# Altium project ENG_BLDC_Motor_Controller.PrjPcb
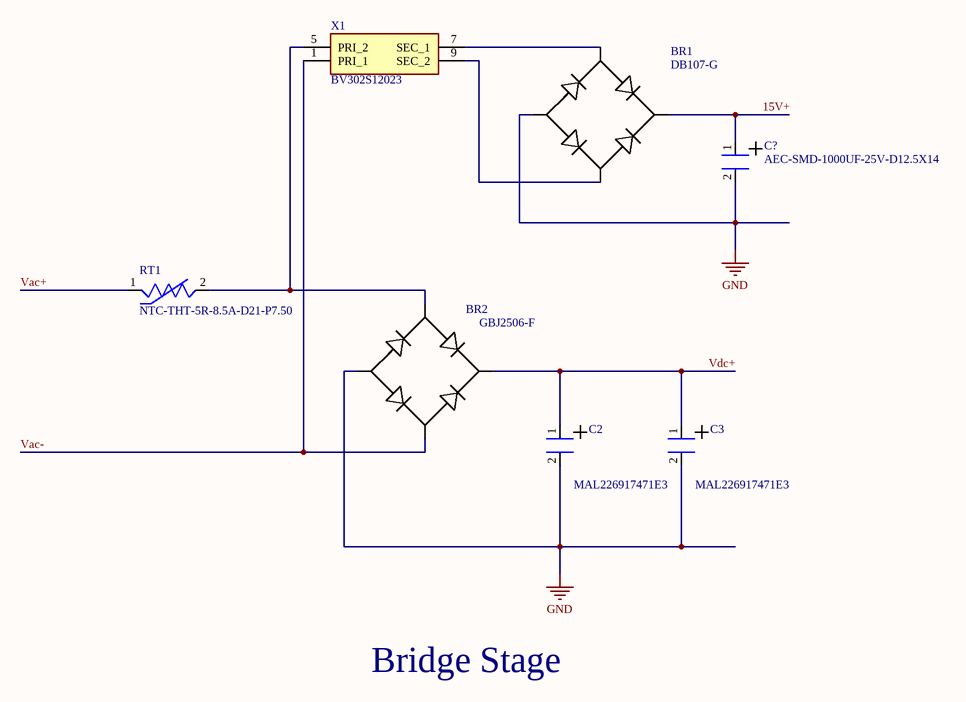
[diagram p0: 01_Bridge_Stage.SchDoc]
3 sheets, 49 parts. Net scope: global (net labels, ports and power ports of the same name join across sheets).
Board file: PCB_Main.PcbDoc
Sheets:
  01_Bridge_Stage.SchDoc
  02_MosfetDrive_Stage.SchDoc
  03_Headers-Mesaurements.SchDoc

## Sheet 01_Bridge_Stage.SchDoc
size A4; SheetNumber: 1; SheetTotal: 3

### Parts
BR1  DB107-G  [895_DB107-G]
BR2  GBJ2506-F  [996_GBJ2506-F]
C2  MAL226917471E3  [099_MAL226917471E3]
C3  MAL226917471E3  [099_MAL226917471E3]
C?  AEC-SMD-1000UF-25V-D12.5X14  [096_AEC-SMD-1000UF-25V-D12.5X14]
RT1  NTC-THT-5R-8.5A-D21-P7.50  [308_NTC-THT-5R-8.5A-D21-P7.50]
X1  BV302S12023  [899_BV302S12023]

### Nets
GND: BR1.2 BR2.4 C2.2 C3.2 C?.2
15V+: BR1.1 C?.1
Vac+: RT1.1
Vac-: BR2.3 X1.1(PRI_1)
Vdc+: BR2.1 C2.1 C3.1
NetBR1_3: BR1.3 X1.7(SEC_1)
NetBR1_4: BR1.4 X1.9(SEC_2)
NetBR2_2: BR2.2 RT1.2 X1.5(PRI_2)

### Notes on the sheet
- Bridge Stage

### Library data of the parts
BR1 = DB107-G: Single-phase bridge rectifier, 1 A, 1000 V, 4-pin through-hole DB package. Rectifies the auxiliary transformer output.; Manufacturer_Name: MCC; Manufacturer_Part_Number: DB107-BP; Copyright: Copyright (C) 2026 Ultra Librarian. All rights reserved.
BR2 = GBJ2506-F: Bridge Rectifier; Manufacturer_Name: Diodes Incorporated; Datasheet Link: https://www.google.co.uk/search?q=diodes+GBJ2506-F&rlz=1C1CHBF_en-GBGB756GB756&oq=diodes+GBJ2506-F&aqs=chrome..69i57j69i64.1269j0j4&sourceid=chrome&ie=UTF-8; Manufacturer_Part_Number: GBJ2506-F; Mouser Part Number: 621-GBJ2506-F; Mouser Price/Stock: https://www.mouser.co.uk/ProductDetail/Diodes-Incorporated/GBJ2506-F?qs=mQbszxtPdlOUVtYxZe82iQ%3D%3D; Arrow Part Number: GBJ2506-F; Arrow Price/Stock: https://www.arrow.com/en/products/gbj2506-f/diodes-incorporated.html?utm_currency=USD&region=europe
C2 C3 = MAL226917471E3: 470 µF, 450 V polarized aluminum electrolytic capacitor, snap-in THT, Ø35 mm body, 10 mm lead spacing, 105 °C rated.
C? = AEC-SMD-1000UF-25V-D12.5X14: Polarized SMD aluminum electrolytic capacitor, 1000 µF, 25 V, Ø12.5 × 14 mm. Filters the auxiliary DC supply.
RT1 = NTC-THT-5R-8.5A-D21-P7.50: Through-hole NTC inrush current limiter, 5 Ω at 25 °C, 8.5 A, Ø21 mm disc, 7.50 mm lead pitch. Limits the DC-link capacitor charging current at power-up.; MF: EPCOS; MP: B57211P0509M301; Package: None; Price: None; Check_prices: https://www.snapeda.com/parts/B57211P0509M301/EPCOS/view-part/?ref=eda; Value: *; SnapEDA_Link: https://www.snapeda.com/parts/B57211P0509M301/EPCOS/view-part/?ref=snap; Availability: In Stock; Purchase-URL: https://pricing.snapeda.com/search?q=B57211P0509M301&ref=eda
X1 = BV302S12023: 2.3VA Encapsulated Transformer 50/60Hz; Manufacturer_Name: Zettler Group; Geometry.Height: 29.8mm; Manufacturer_Part_Number: BV302S12023; Mouser Part Number: *; Mouser Price/Stock: *; Arrow Part Number: *; Arrow Price/Stock: *; Datasheet Link: https://www.zettlermagnetics.com/pdfs/EI30_23.pdf

## Sheet 02_MosfetDrive_Stage.SchDoc
size A4; SheetNumber: 2; SheetTotal: 3
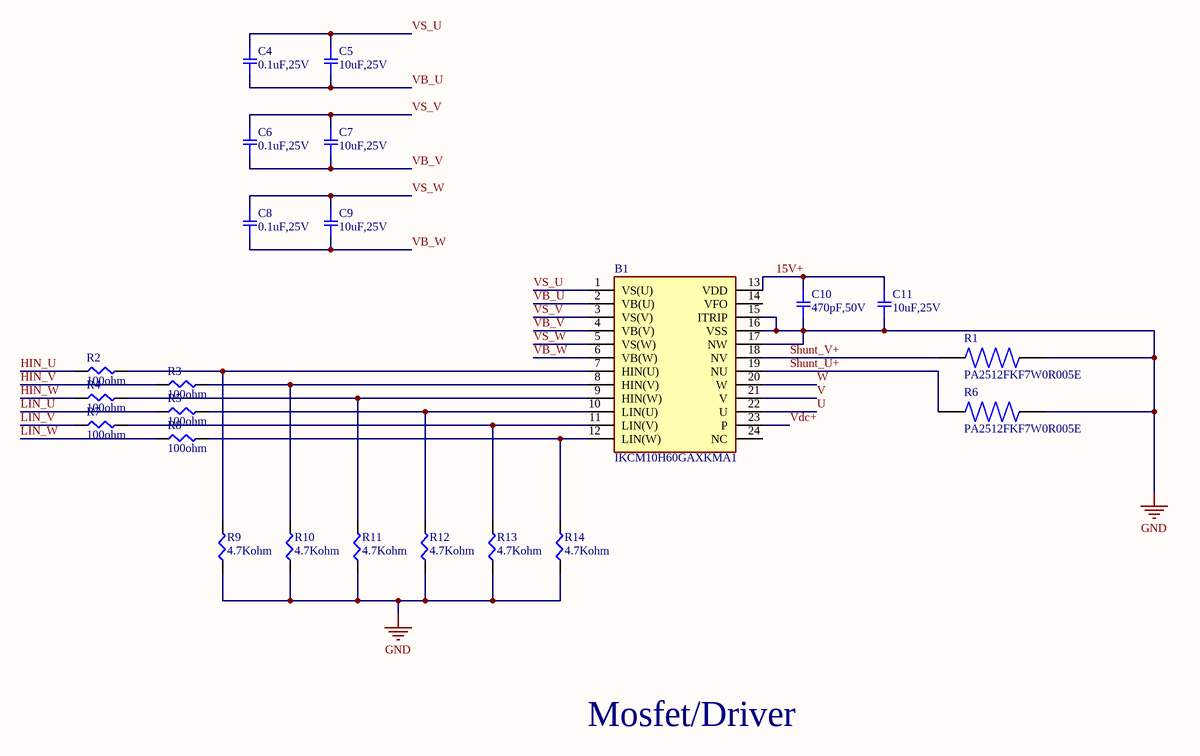
[diagram p1: 02_MosfetDrive_Stage.SchDoc]

### Parts
B1  IKCM10H60GAXKMA1  [997_IKCM10H60GAXKMA1]
C4  0.1uF,25V  [001_SMD-1206]
C5  10uF,25V  [001_SMD-1206]
C6  0.1uF,25V  [001_SMD-1206]
C7  10uF,25V  [001_SMD-1206]
C8  0.1uF,25V  [001_SMD-1206]
C9  10uF,25V  [001_SMD-1206]
C10  470pF,50V  [001_SMD-1206]
C11  10uF,25V  [001_SMD-1206]
R1  PA2512FKF7W0R005E  [097_PA2512FKF7W0R005E]
R2  100ohm  [001_SMD-1206]
R3  100ohm  [001_SMD-1206]
R4  100ohm  [001_SMD-1206]
R5  100ohm  [001_SMD-1206]
R6  PA2512FKF7W0R005E  [097_PA2512FKF7W0R005E]
R7  100ohm  [001_SMD-1206]
R8  100ohm  [001_SMD-1206]
R9  4.7Kohm  [001_SMD-1206]
R10  4.7Kohm  [001_SMD-1206]
R11  4.7Kohm  [001_SMD-1206]
R12  4.7Kohm  [001_SMD-1206]
R13  4.7Kohm  [001_SMD-1206]
R14  4.7Kohm  [001_SMD-1206]

### Nets
GND: B1.15(ITRIP) B1.16(VSS) B1.17(NW) C10.2 C11.2 R1.2 R6.2 R9.1 R10.1 R11.1 R12.1 R13.1 R14.1
15V+: B1.13(VDD) C10.1 C11.1
HIN_U: R2.1
HIN_V: R3.1
HIN_W: R4.1
LIN_U: R5.1
LIN_V: R7.1
LIN_W: R8.1
Shunt_U+: B1.19(NU) R6.1
Shunt_V+: B1.18(NV) R1.1
U: B1.22(U)
V: B1.21(V)
VB_U: B1.2(VB(U)) C4.2 C5.2
VB_V: B1.4(VB(V)) C6.2 C7.2
VB_W: B1.6(VB(W)) C8.2 C9.2
Vdc+: B1.23(P)
VS_U: B1.1(VS(U)) C4.1 C5.1
VS_V: B1.3(VS(V)) C6.1 C7.1
VS_W: B1.5(VS(W)) C8.1 C9.1
W: B1.20(W)
NetB1_7: B1.7(HIN(U)) R2.2 R9.2
NetB1_8: B1.8(HIN(V)) R3.2 R10.2
NetB1_9: B1.9(HIN(W)) R4.2 R11.2
NetB1_10: B1.10(LIN(U)) R5.2 R12.2
NetB1_11: B1.11(LIN(V)) R7.2 R13.2
NetB1_12: B1.12(LIN(W)) R8.2 R14.2

Not connected (* = marked no-connect by the designer): B1 14(VFO) 24(NC)

### Notes on the sheet
- Mosfet/Driver

### Library data of the parts
B1 = IKCM10H60GAXKMA1: Intelligent Power Module 3-Ph 600V 10A; Manufacturer_Name: Infineon; Geometry.Height: 5.6mm; Manufacturer_Part_Number: IKCM10H60GAXKMA1; Mouser Part Number: 726-IKCM10H60GAXKMA1; Mouser Price/Stock: https://www.mouser.co.uk/ProductDetail/Infineon-Technologies/IKCM10H60GAXKMA1?qs=hdSwu7a6m9Y5VjDgSjSs%2Fw%3D%3D; Arrow Part Number: IKCM10H60GAXKMA1; Arrow Price/Stock: https://www.arrow.com/en/products/ikcm10h60gaxkma1/infineon-technologies-ag; Datasheet Link: https://www.infineon.com/dgdl/Infineon-IKCM10H60GA-DS-v02_04-EN.pdf?fileId=5546d4624fb7fef2014fcb43a49a78bb
C4-C11 = C_1206_Template: CAP CER 1206; Part Number: GC321AD72E103KX01D; Manufacturer: Murata Electronics North America; Factory Stock: 0; Unit Price (USD): 0.3; Minimum Quantity: 1; Value: 10000pF; Tolerance: ±10%; Voltage: 250V; Temperature Coefficient: X7T; Datasheets: http://search.murata.co.jp/Ceramy/image/img/A01X/G101/ENG/GC321AD72E103KX01-01.pdf; Image: //media.digikey.com/Renders/Murata%20Renders/0805(GC3)200x125.jpg; Digi-Key Part Number: 490-13986-1-ND; Quantity Available: 4000; @ qty: 0; Packaging: Cut Tape (CT); Series: GC3; Part Status: Active; Operating Temperature: -55°C ~ 125°C; Features: -; Ratings: AEC-Q200; Applications: Automotive; Mounting Type: Surface Mount, MLCC; Package / Case: 0805 (2012 Metric); Size / Dimension: 0.079" L x 0.049" W (2.00mm x 1.25mm); Height - Seated (Max): -; Thickness (Max): 0.039" (1.00mm); Lead Spacing: -; Lead Style: -
R1 R6 = PA2512FKF7W0R005E: 5 mΩ, 2 W, ±1% current-sense shunt resistor, 2512 (6332 metric) SMD package, low-resistance metal-element construction.; MF: Bourns; MP: CRF2512-FZ-R005ELF; SnapEDA_Link: https://www.snapeda.com/parts/CRF2512-FZ-R005ELF/Bourns/view-part/?ref=snap; Package: 6432 Bourns; Value: *; Check_prices: https://www.snapeda.com/parts/CRF2512-FZ-R005ELF/Bourns/view-part/?ref=eda
R2-R5 R7-R14 = R_1206_Template: RES SMD 1206; Part Number: ERJ-8BQF1R0V; Manufacturer: Panasonic Electronic Components; Factory Stock: 0; Unit Price (USD): 0.05778; @ qty: 1500; Minimum Quantity: 1; Value: 1; Tolerance: ±1%; Power (Watts): 0.5W, 1/2W; Temperature Coefficient: ±200ppm/°C; Datasheets: https://industrial.panasonic.com/cdbs/www-data/pdf/RDA0000/AOA0000C239.pdf; Image: //media.digikey.com/Renders/Panasonic%20Renders/ERJ-1206%20Pkg.jpg; Digi-Key Part Number: P17600CT-ND; Quantity Available: 2046; Packaging: Cut Tape (CT); Series: ERJ; Part Status: Active; Composition: Thick Film; Features: Automotive AEC-Q200, Current Sense; Operating Temperature: -55°C ~ 125°C; Package / Case: 1206 (3216 Metric); Supplier Device Package: 1206; Size / Dimension: 0.126" L x 0.063" W (3.20mm x 1.60mm); Height - Seated (Max): 0.028" (0.70mm); Number of Terminations: 2; Failure Rate: -

## Sheet 03_Headers-Mesaurements.SchDoc
size A4; SheetNumber: 3; SheetTotal: 3
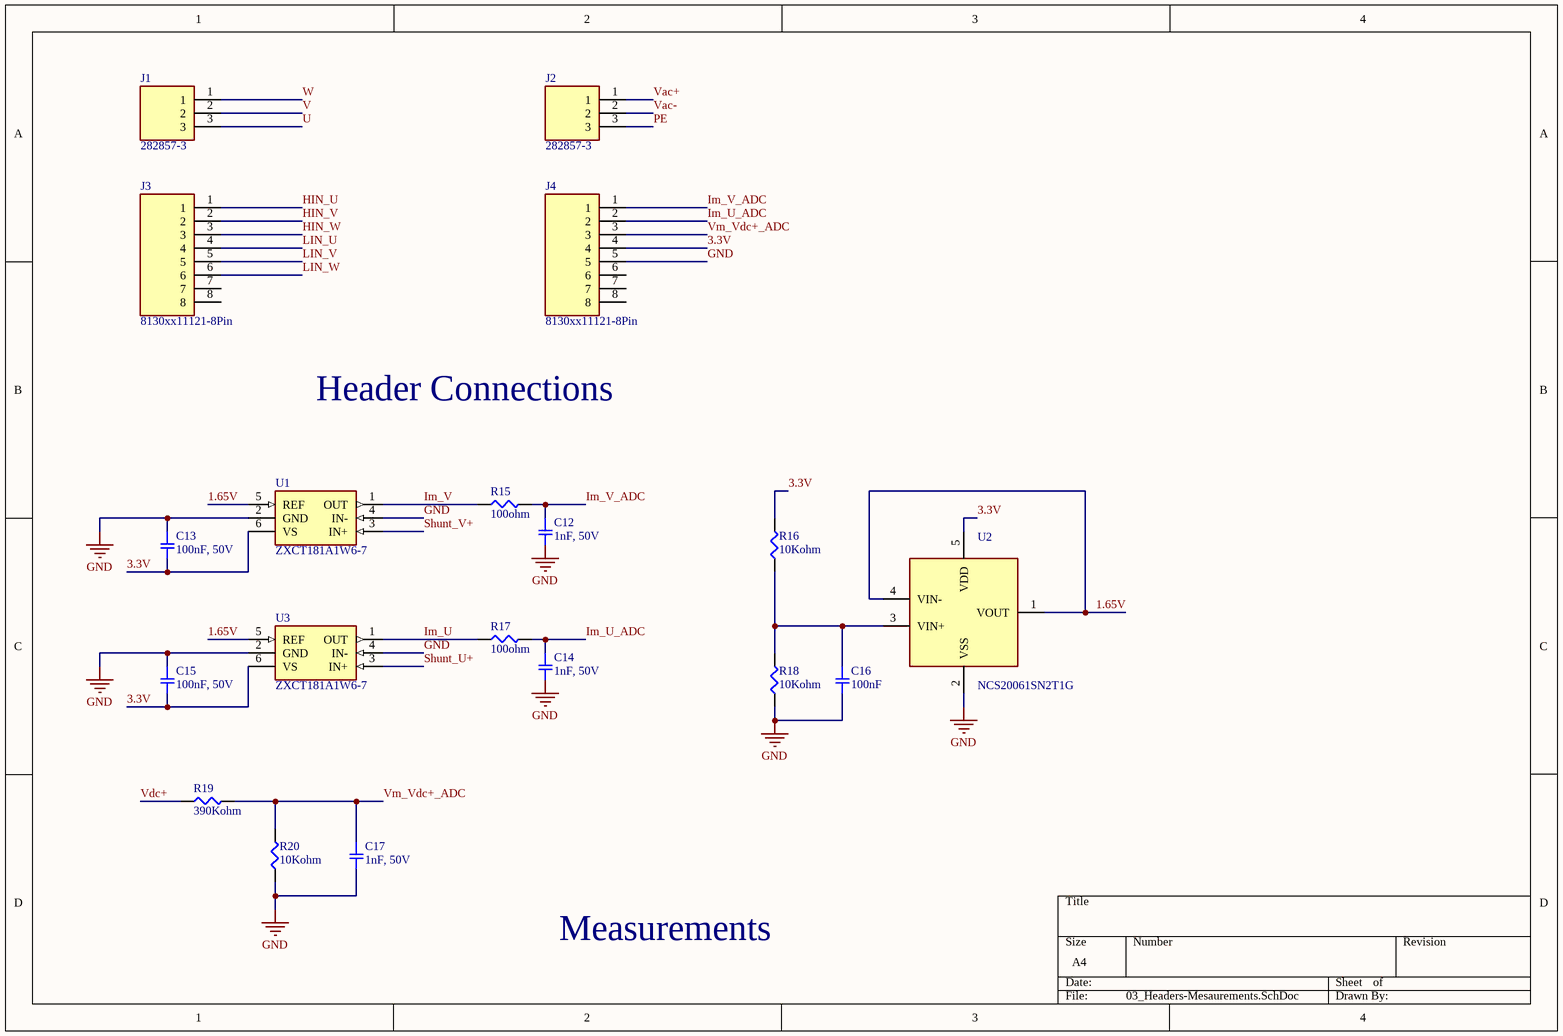
[diagram p2: 03_Headers-Mesaurements.SchDoc]

### Parts
C12  1nF, 50V  [001_SMD-1206]
C13  100nF, 50V  [001_SMD-1206]
C14  1nF, 50V  [001_SMD-1206]
C15  100nF, 50V  [001_SMD-1206]
C16  100nF  [001_SMD-1206]
C17  1nF, 50V  [001_SMD-1206]
J1  282857-3  [201_TE_282857-3]
J2  282857-3  [201_TE_282857-3]
J3  8130xx11121-8Pin  [200_HDRV6W64P0X254_1X6_1524X254X869P]
J4  8130xx11121-8Pin  [200_HDRV6W64P0X254_1X6_1524X254X869P]
R15  100ohm  [001_SMD-1206]
R16  10Kohm  [001_SMD-1206]
R17  100ohm  [001_SMD-1206]
R18  10Kohm  [001_SMD-1206]
R19  390Kohm  [001_SMD-1206]
R20  10Kohm  [001_SMD-1206]
U1  ZXCT181A1W6-7  [896_ZXCT181A1W6-7]
U2  NCS20061SN2T1G  [897_NCS20061SN2T1G]
U3  ZXCT181A1W6-7  [896_ZXCT181A1W6-7]

### Nets
GND: C12.2 C13.1 C14.2 C15.1 C16.2 C17.2 J4.5 R18.1 R20.1 U1.2(GND) U1.4(IN-) U2.2(VSS) U3.2(GND) U3.4(IN-)
1.65V: U1.5(REF) U2.1(VOUT) U2.4(VIN-) U3.5(REF)
3.3V: C13.2 C15.2 J4.4 R16.2 U1.6(VS) U2.5(VDD) U3.6(VS)
HIN_U: J3.1
HIN_V: J3.2
HIN_W: J3.3
Im_U: R17.1 U3.1(OUT)
Im_U_ADC: C14.1 J4.2 R17.2
Im_V: R15.1 U1.1(OUT)
Im_V_ADC: C12.1 J4.1 R15.2
LIN_U: J3.4
LIN_V: J3.5
LIN_W: J3.6
PE: J2.3
Shunt_U+: U3.3(IN+)
Shunt_V+: U1.3(IN+)
U: J1.3
V: J1.2
Vac+: J2.1
Vac-: J2.2
Vdc+: R19.1
Vm_Vdc+_ADC: C17.1 J4.3 R19.2 R20.2
W: J1.1
NetC16_1: C16.1 R16.1 R18.2 U2.3(VIN+)

Not connected (* = marked no-connect by the designer): J3 7 8; J4 6 7 8

### Notes on the sheet
- Header Connections
- Measurements

### Library data of the parts
C12-C17 = C_1206_Template: as C4 on sheet 02_MosfetDrive_Stage; Datasheets: http://search.murata.co.jp/Ceramy/image/img/A01X/G101/ENG/GC321AD72E103KX01-01.pdf; Image: //media.digikey.com/Renders/Murata%20Renders/0805(GC3)200x125.jpg; Digi-Key Part Number: 490-13986-1-ND; Quantity Available: 4000; @ qty: 0; Packaging: Cut Tape (CT); Series: GC3; Part Status: Active; Operating Temperature: -55°C ~ 125°C; Features: -; Ratings: AEC-Q200; Applications: Automotive; Mounting Type: Surface Mount, MLCC; Package / Case: 0805 (2012 Metric); Size / Dimension: 0.079" L x 0.049" W (2.00mm x 1.25mm); Height - Seated (Max): -; Thickness (Max): 0.039" (1.00mm); Lead Spacing: -; Lead Style: -
J1 J2 = 282857-3: 3 Position Wire to Board Terminal Block Horizontal with Board 0.200 (5.08mm) Through Hole; MF: TE Connectivity; SnapEDA_Link: https://www.snapeda.com/parts/282857-3/TE+Connectivity+AMP+Connectors/view-part/?ref=snap; Package: None; Value: *; MP: 282857-3; EU_RoHS_Compliance: Compliant with Exemptions; Check_prices: https://www.snapeda.com/parts/282857-3/TE+Connectivity+AMP+Connectors/view-part/?ref=eda
J3 J4 = 6130xx11121-6Pin: 2.54MM PIN HEADER; Manufacturer_Name: Wurth Elektronik; Geometry.Height: 8.69mm; Manufacturer_Part_Number: 6130xx11121-6Pin; Mouser Part Number: *; Mouser Price/Stock: *; Arrow Part Number: *; Arrow Price/Stock: *; Datasheet Link: https://www.we-online.com/katalog/datasheet/6130xx11121.pdf
R15-R20 = R_1206_Template: as R2 on sheet 02_MosfetDrive_Stage; Datasheets: https://industrial.panasonic.com/cdbs/www-data/pdf/RDA0000/AOA0000C239.pdf; Image: //media.digikey.com/Renders/Panasonic%20Renders/ERJ-1206%20Pkg.jpg; Digi-Key Part Number: P17600CT-ND; Quantity Available: 2046; Packaging: Cut Tape (CT); Series: ERJ; Part Status: Active; Composition: Thick Film; Features: Automotive AEC-Q200, Current Sense; Operating Temperature: -55°C ~ 125°C; Package / Case: 1206 (3216 Metric); Supplier Device Package: 1206; Size / Dimension: 0.126" L x 0.063" W (3.20mm x 1.60mm); Height - Seated (Max): 0.028" (0.70mm); Number of Terminations: 2; Failure Rate: -
U1 U3 = ZXCT181A1W6-7: Bidirectional high-side current-sense amplifier, fixed gain 20 V/V, 2.7–5.5 V supply, up to 26 V common-mode input range, SOT-26 package.; MF: Texas Instruments; MP: INA181A1IDBVR; SnapEDA_Link: https://www.snapeda.com/parts/INA181A1IDBVR/Texas+Instruments/view-part/?ref=snap; Package: SOT-23-6 Texas Instruments; Value: *; Check_prices: https://www.snapeda.com/parts/INA181A1IDBVR/Texas+Instruments/view-part/?ref=eda
U2 = NCS20061SN2T1G: Single, rail-to-rail operational amplifier used as a voltage buffer for the 1.65 V current-sense reference.

## Nets that join several sheets
GND: 01_Bridge_Stage (5 pins), 02_MosfetDrive_Stage (13 pins), 03_Headers-Mesaurements (14 pins)
15V+: 01_Bridge_Stage (BR1.1 C?.1), 02_MosfetDrive_Stage (B1.13 C10.1 C11.1)
HIN_U: 02_MosfetDrive_Stage (R2.1), 03_Headers-Mesaurements (J3.1)
HIN_V: 02_MosfetDrive_Stage (R3.1), 03_Headers-Mesaurements (J3.2)
HIN_W: 02_MosfetDrive_Stage (R4.1), 03_Headers-Mesaurements (J3.3)
LIN_U: 02_MosfetDrive_Stage (R5.1), 03_Headers-Mesaurements (J3.4)
LIN_V: 02_MosfetDrive_Stage (R7.1), 03_Headers-Mesaurements (J3.5)
LIN_W: 02_MosfetDrive_Stage (R8.1), 03_Headers-Mesaurements (J3.6)
Shunt_U+: 02_MosfetDrive_Stage (B1.19 R6.1), 03_Headers-Mesaurements (U3.3)
Shunt_V+: 02_MosfetDrive_Stage (B1.18 R1.1), 03_Headers-Mesaurements (U1.3)
U: 02_MosfetDrive_Stage (B1.22), 03_Headers-Mesaurements (J1.3)
V: 02_MosfetDrive_Stage (B1.21), 03_Headers-Mesaurements (J1.2)
Vac+: 01_Bridge_Stage (RT1.1), 03_Headers-Mesaurements (J2.1)
Vac-: 01_Bridge_Stage (BR2.3 X1.1), 03_Headers-Mesaurements (J2.2)
Vdc+: 01_Bridge_Stage (BR2.1 C2.1 C3.1), 02_MosfetDrive_Stage (B1.23), 03_Headers-Mesaurements (R19.1)
W: 02_MosfetDrive_Stage (B1.20), 03_Headers-Mesaurements (J1.1)